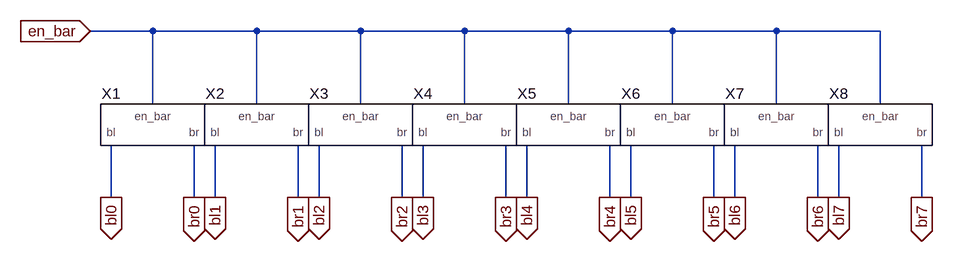
[diagram p0: schematic precharge_array.asc]
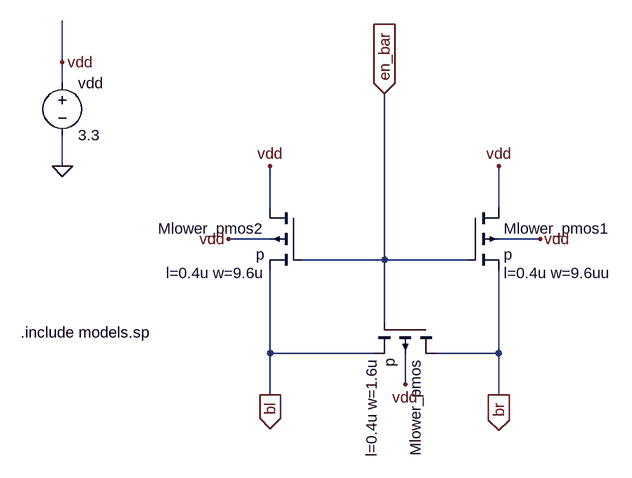
[diagram p1: sub-circuit precharge.asc]
precharge_array.asc, the LTspice schematic file:
Version 4
SHEET 1 880 680
WIRE -400 -16 -496 -16
WIRE -240 -16 -400 -16
WIRE -80 -16 -240 -16
WIRE 80 -16 -80 -16
WIRE 240 -16 80 -16
WIRE 400 -16 240 -16
WIRE 560 -16 400 -16
WIRE 720 -16 560 -16
WIRE -400 96 -400 -16
WIRE -240 96 -240 -16
WIRE -80 96 -80 -16
WIRE 80 96 80 -16
WIRE 240 96 240 -16
WIRE 400 96 400 -16
WIRE 560 96 560 -16
WIRE 720 96 720 -16
WIRE -464 240 -464 160
WIRE -336 240 -336 160
WIRE -304 240 -304 160
WIRE -176 240 -176 160
WIRE -144 240 -144 160
WIRE -16 240 -16 160
WIRE 16 240 16 160
WIRE 144 240 144 160
WIRE 176 240 176 160
WIRE 304 240 304 160
WIRE 336 240 336 160
WIRE 464 240 464 160
WIRE 496 240 496 160
WIRE 624 240 624 160
WIRE 656 240 656 160
WIRE 784 240 784 160
FLAG -464 240 bl0
IOPIN -464 240 Out
FLAG -336 240 br0
IOPIN -336 240 Out
FLAG -304 240 bl1
IOPIN -304 240 Out
FLAG -176 240 br1
IOPIN -176 240 Out
FLAG -144 240 bl2
IOPIN -144 240 Out
FLAG -16 240 br2
IOPIN -16 240 Out
FLAG 16 240 bl3
IOPIN 16 240 Out
FLAG 144 240 br3
IOPIN 144 240 Out
FLAG 176 240 bl4
IOPIN 176 240 Out
FLAG 304 240 br4
IOPIN 304 240 Out
FLAG 336 240 bl5
IOPIN 336 240 Out
FLAG 464 240 br5
IOPIN 464 240 Out
FLAG 496 240 bl6
IOPIN 496 240 Out
FLAG 624 240 br6
IOPIN 624 240 Out
FLAG 656 240 bl7
IOPIN 656 240 Out
FLAG 784 240 br7
IOPIN 784 240 Out
FLAG -496 -16 en_bar
IOPIN -496 -16 In
SYMBOL precharge -400 128 R0
SYMATTR InstName X1
SYMBOL precharge -240 128 R0
SYMATTR InstName X2
SYMBOL precharge -80 128 R0
SYMATTR InstName X3
SYMBOL precharge 80 128 R0
SYMATTR InstName X4
SYMBOL precharge 240 128 R0
SYMATTR InstName X5
SYMBOL precharge 400 128 R0
SYMATTR InstName X6
SYMBOL precharge 560 128 R0
SYMATTR InstName X7
SYMBOL precharge 720 128 R0
SYMATTR InstName X8

precharge.asc, the sub-circuit schematic file:
Version 4
SHEET 1 880 680
WIRE -448 -64 -448 -128
WIRE -448 -32 -448 -64
WIRE -448 96 -448 48
WIRE -128 160 -128 96
WIRE 224 160 224 96
WIRE -128 208 -192 208
WIRE 288 208 224 208
WIRE 48 240 48 -16
WIRE 48 240 -80 240
WIRE 176 240 48 240
WIRE 48 336 48 240
WIRE -128 384 -128 256
WIRE 32 384 -128 384
WIRE 224 384 224 256
WIRE 224 384 128 384
WIRE 80 432 80 384
WIRE -128 448 -128 384
WIRE 224 448 224 384
FLAG -448 96 0
FLAG 288 208 vdd
FLAG -192 208 vdd
FLAG 80 432 vdd
FLAG 224 96 vdd
FLAG -128 96 vdd
FLAG -128 448 bl
IOPIN -128 448 Out
FLAG 224 448 br
IOPIN 224 448 Out
FLAG 48 -16 en_bar
IOPIN 48 -16 In
FLAG -448 -64 vdd
SYMBOL pmos4 128 336 R90
WINDOW 123 56 100 Left 2
SYMATTR Value2 l=0.4u w=1.6u
SYMATTR InstName Mlower_pmos
SYMATTR Value p
SYMBOL pmos4 176 160 R0
WINDOW 123 56 100 Left 2
SYMATTR Value2 l=0.4u w=9.6uu
SYMATTR InstName Mlower_pmos1
SYMATTR Value p
SYMBOL pmos4 -80 160 M0
WINDOW 123 56 100 Left 2
SYMATTR Value2 l=0.4u w=9.6u
SYMATTR InstName Mlower_pmos2
SYMATTR Value p
SYMBOL voltage -448 -48 R0
SYMATTR InstName vdd
SYMATTR Value 3.3
TEXT -512 352 Left 2 !.include models.sp

The netlist it stands for:
* precharge_array.asc
XX1 en_bar bl0 br0 precharge
XX2 en_bar bl1 br1 precharge
XX3 en_bar bl2 br2 precharge
XX4 en_bar bl3 br3 precharge
XX5 en_bar bl4 br4 precharge
XX6 en_bar bl5 br5 precharge
XX7 en_bar bl6 br6 precharge
XX8 en_bar bl7 br7 precharge

* block symbol definitions
.subckt precharge en_bar bl br
Mlower_pmos br en_bar bl vdd p l=0.4u w=1.6u
Mlower_pmos1 vdd en_bar br vdd p l=0.4u w=9.6uu
Mlower_pmos2 vdd en_bar bl vdd p l=0.4u w=9.6u
vdd vdd 0 3.3
.include models.sp
.ends precharge

.model NMOS NMOS
.model PMOS PMOS
.lib standard.mos
.backanno
.end